# EasyEDA Pro project 电磁杆.eprj

# Schematic Schematic1
Create Date: 2024-03-12; Page Name: P1; Project Name: 电磁杆; Schematic Name: Schematic1; Update Date: 2024-03-24; Company: 嘉立创EDA; Page Size: A4; Version: V1.0
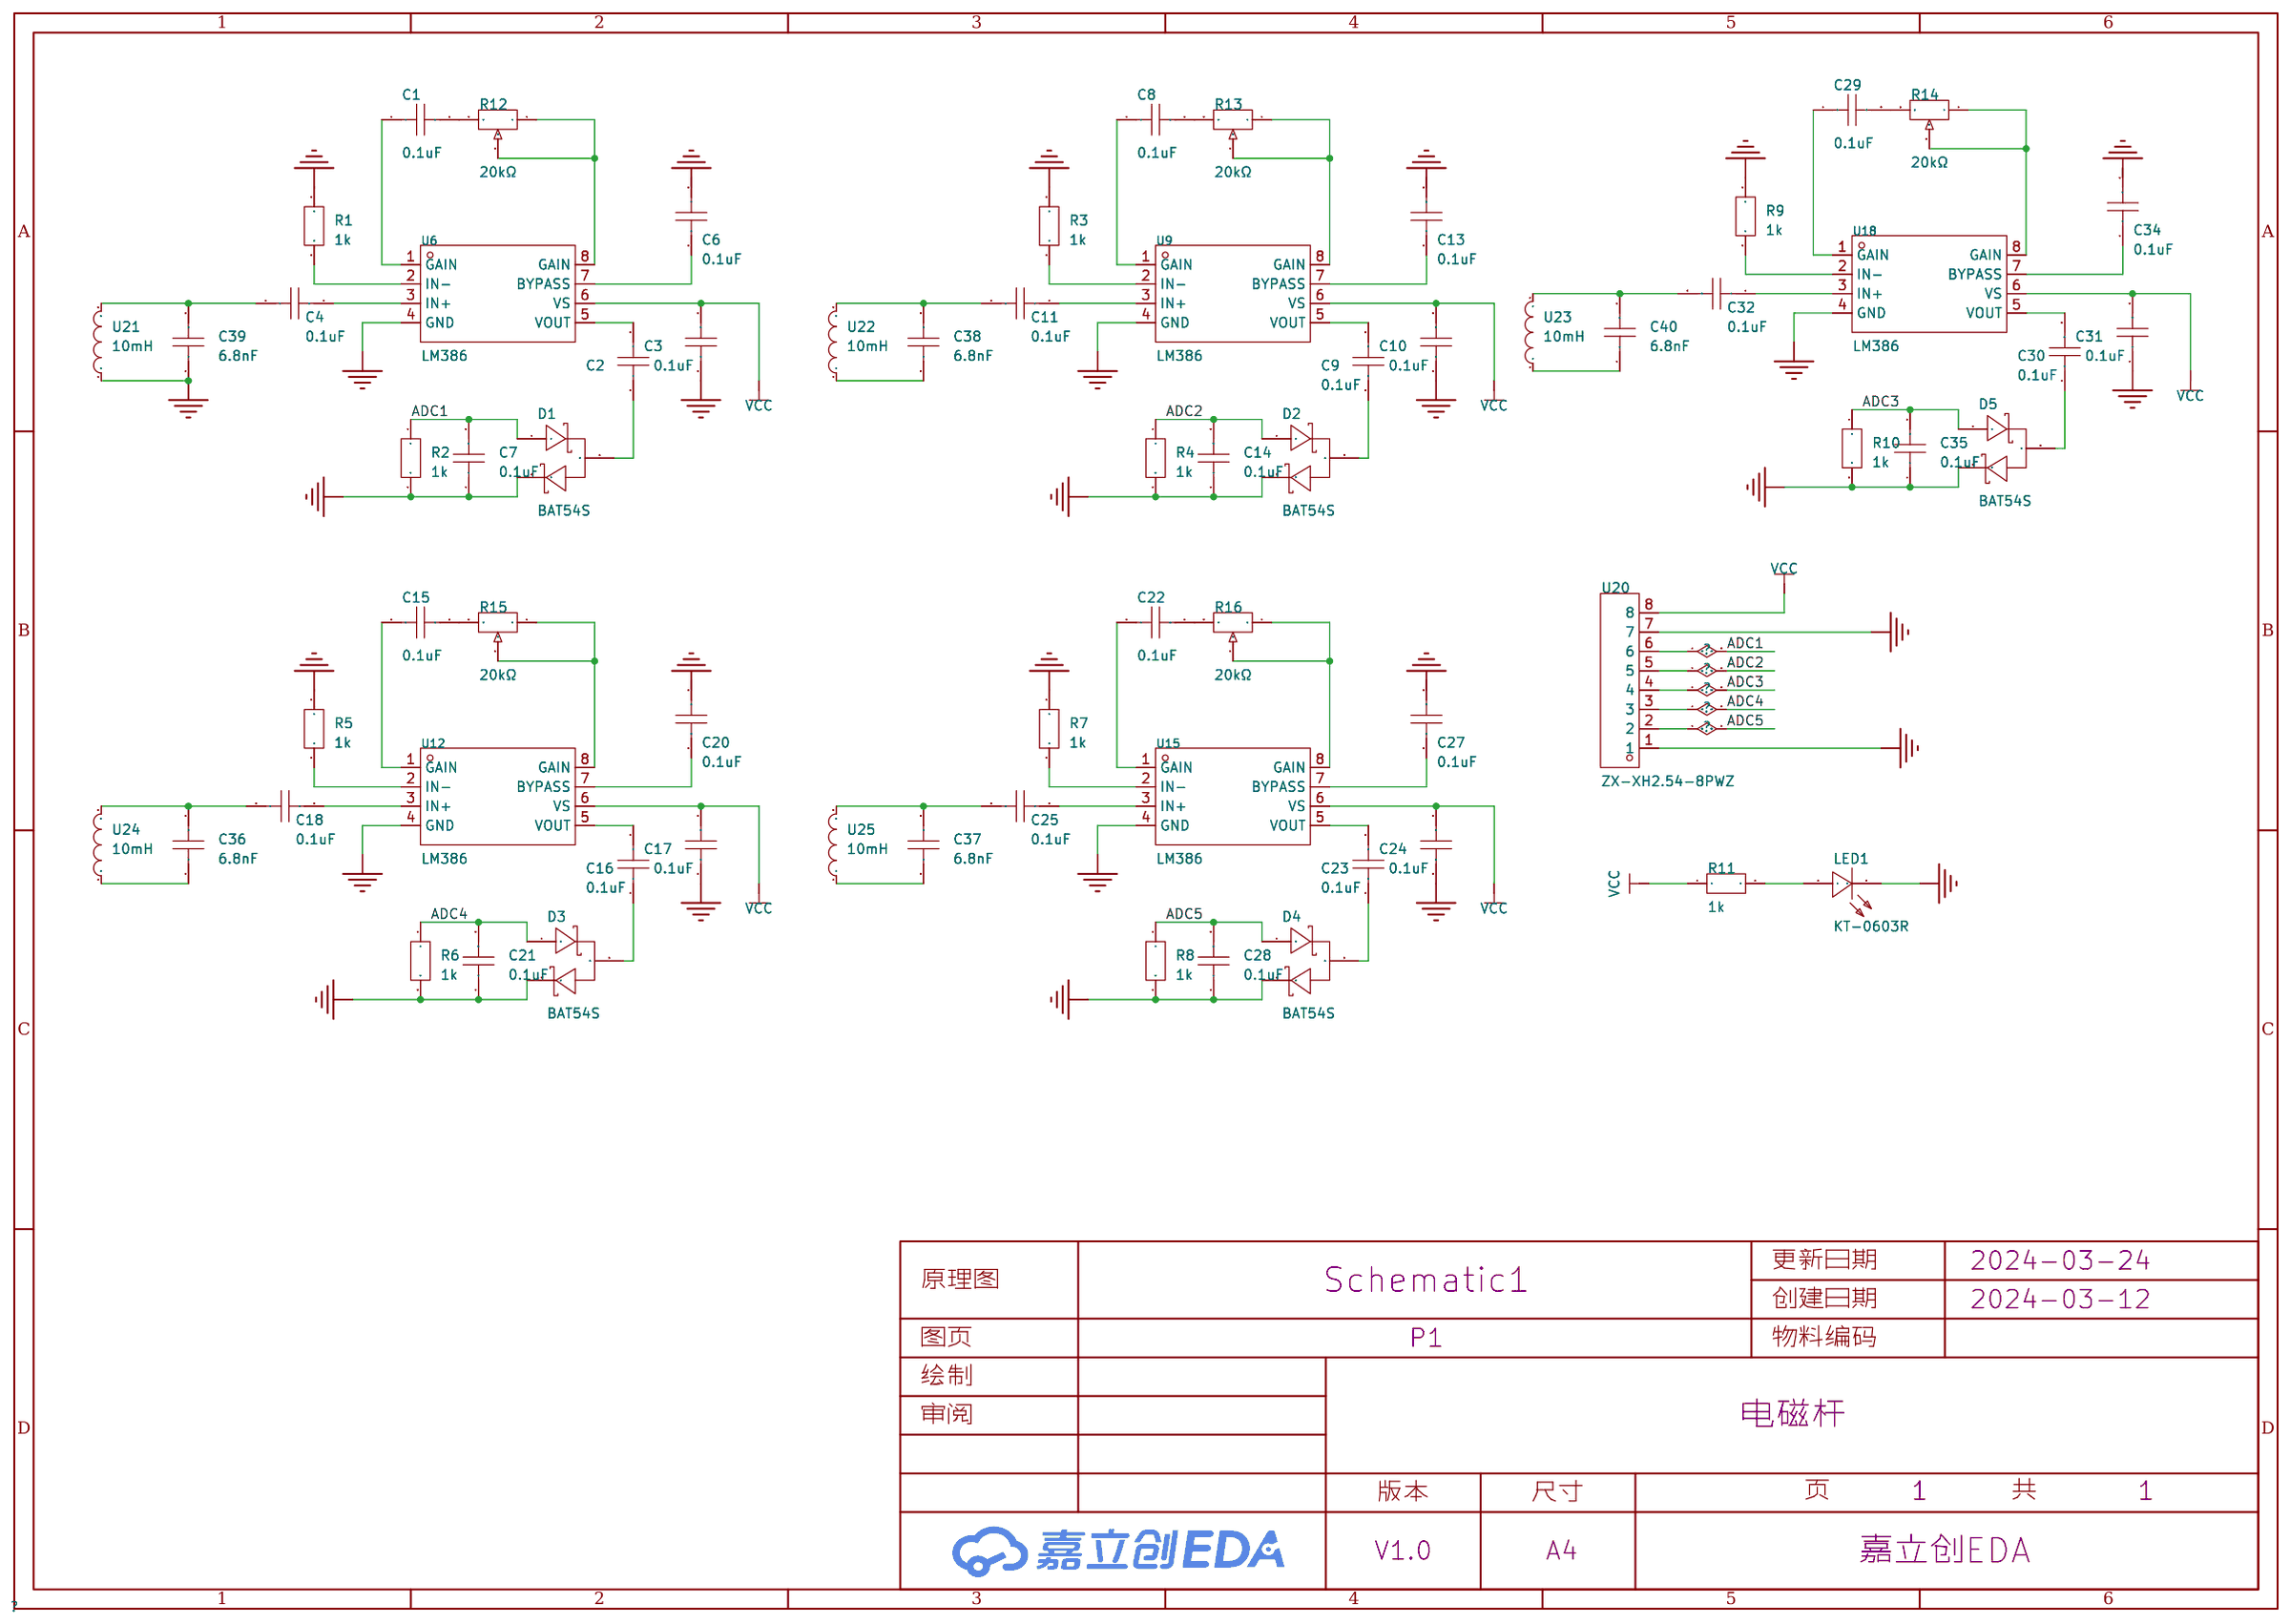
[diagram p0: schematic sheet]

## Parts
C1  0.1uF  [C0805]
C2  104  [C0805]
C3  0.1uF  [C0805]
C4  0.1uF  [C0805]
C6  0.1uF  [C0805]
C7  0.1uF  [C0805]
C8  0.1uF  [C0805]
C9  0.1uF  [C0805]
C10  0.1uF  [C0805]
C11  0.1uF  [C0805]
C13  0.1uF  [C0805]
C14  0.1uF  [C0805]
C15  0.1uF  [C0805]
C16  0.1uF  [C0805]
C17  0.1uF  [C0805]
C18  0.1uF  [C0805]
C20  0.1uF  [C0805]
C21  0.1uF  [C0805]
C22  0.1uF  [C0805]
C23  0.1uF  [C0805]
C24  0.1uF  [C0805]
C25  0.1uF  [C0805]
C27  0.1uF  [C0805]
C28  0.1uF  [C0805]
C29  0.1uF  [C0805]
C30  0.1uF  [C0805]
C31  0.1uF  [C0805]
C32  0.1uF  [C0805]
C34  0.1uF  [C0805]
C35  0.1uF  [C0805]
C36  6.8nF  [CAP-TH_L7.2-W2.5-P5.00-D0.5]
C37  6.8nF  [CAP-TH_L7.2-W2.5-P5.00-D0.5]
C38  6.8nF  [CAP-TH_L7.2-W2.5-P5.00-D0.5]
C39  6.8nF  [CAP-TH_L7.2-W2.5-P5.00-D0.5]
C40  6.8nF  [CAP-TH_L7.2-W2.5-P5.00-D0.5]
D1  BAT54S  [SOT-23-3_L2.9-W1.3-P1.90-LS2.4-BR]
D2  BAT54S  [SOT-23-3_L2.9-W1.3-P1.90-LS2.4-BR]
D3  BAT54S  [SOT-23-3_L2.9-W1.3-P1.90-LS2.4-BR]
D4  BAT54S  [SOT-23-3_L2.9-W1.3-P1.90-LS2.4-BR]
D5  BAT54S  [SOT-23-3_L2.9-W1.3-P1.90-LS2.4-BR]
LED1  KT-0603R  [LED0603-RD]
R1  1k  [R0805]
R2  1k  [R0805]
R3  1k  [R0805]
R4  1k  [R0805]
R5  1k  [R0805]
R6  1k  [R0805]
R7  1k  [R0805]
R8  1k  [R0805]
R9  1k  [R0805]
R10  1k  [R0805]
R11  1k  [R0805]
R12  20kΩ  [RES-ADJ-TH_3P-L7.1-W6.9-P2.50-L_3362P]
R13  20kΩ  [RES-ADJ-TH_3P-L7.1-W6.9-P2.50-L_3362P]
R14  20kΩ  [RES-ADJ-TH_3P-L7.1-W6.9-P2.50-L_3362P]
R15  20kΩ  [RES-ADJ-TH_3P-L7.1-W6.9-P2.50-L_3362P]
R16  20kΩ  [RES-ADJ-TH_3P-L7.1-W6.9-P2.50-L_3362P]
U6  LM386  [SOP-8_L4.9-W3.9-P1.27-LS6.0-BL]
U9  LM386  [SOP-8_L4.9-W3.9-P1.27-LS6.0-BL]
U12  LM386  [SOP-8_L4.9-W3.9-P1.27-LS6.0-BL]
U15  LM386  [SOP-8_L4.9-W3.9-P1.27-LS6.0-BL]
U18  LM386  [SOP-8_L4.9-W3.9-P1.27-LS6.0-BL]
U20  ZX-XH2.54-8PWZ  [CONN-TH_8P-P2.50_ZX-XH2.54-8PWZ]
U21  10mH  [IND-TH_BD10.0-P5.00-D0.6]
U22  10mH  [IND-TH_BD10.0-P5.00-D0.6]
U23  10mH  [IND-TH_BD10.0-P5.00-D0.6]
U24  10mH  [IND-TH_BD10.0-P5.00-D0.6]
U25  10mH  [IND-TH_BD10.0-P5.00-D0.6]

## Library data of the parts
C1-C4 C6-C11 C13-C18 C20-C25 C27-C32 C34 C35 = MSASJ21GBB5476MTNA01: 容值:47uF;精度:±20%;额定电压:6.3V;材质(温度系数):X5R;; LCSC Part Name: 47uF ±20% 6.3V; Supplier Part: C5785393; Manufacturer: TAIYO YUDEN(太诱); Supplier Footprint: 0805; JLCPCB Part Class: 扩展库; Supplier: LCSC; Tolerance: ±20%; Voltage Rated: 6.3V; Temperature Coefficient: X5R
C36-C40 = PE104J2A0501: 容值:100nF;精度:±5%;额定电压:100V;介电材料:金属化聚酯;工作温度:-40℃~+85℃;; LCSC Part Name: 100nF ±5% 100V; Supplier Part: C390170; Manufacturer: KYET(科雅); Supplier Footprint: 插件,P=5mm; JLCPCB Part Class: 扩展库; Datasheet: https://atta.szlcsc.com/upload/public/pdf/source/20190521/C390170_A02C70B339AE0619C0AA1506FED178D7.pdf; Supplier: LCSC; Tolerance: ±5%; Voltage Rated: 100V; Dielectric Material: 金属化聚酯; Operating Temperature: -40℃~+85℃
D1-D5 = BAT54S: 正向压降(Vf):1V@100mA;直流反向耐压(Vr):30V;平均整流电流(Io):200mA;; LCSC Part Name: 电压:30V 电流:200mA; Supplier Part: C266597; Manufacturer: BORN(伯恩半导体); Supplier Footprint: SOT-23; JLCPCB Part Class: 扩展库; Datasheet: https://atta.szlcsc.com/upload/public/pdf/source/20180817/C266598_47D685828EC8A63CBB2EC9BA7E026BE3.pdf; Supplier: LCSC; Forward Voltage (Vf@If): 1V@100mA; Reverse Voltage (Vr): 30V; Average Rectified Current (Io): 200mA
LED1 = KT-0603R: 发光颜色:红色;功率:-;正向电流:-;主波长:-;二极管配置:-;透镜颜色:-;色温:-;发光角度:-;载带方式:-;工作温度:-40℃~+85℃;; LCSC Part Name: 0603 红灯 高亮; Supplier Part: C2286; Manufacturer: KENTO; Supplier Footprint: 0603; JLCPCB Part Class: 基础库; Datasheet: https://atta.szlcsc.com/upload/public/pdf/source/20160616/1466072038404.pdf; Supplier: LCSC; Emitted Color: 红色; Operating Temperature: -40℃~+85℃
R1-R11 = AT0805BRD0720RL: 电阻类型:薄膜电阻;阻值:20Ω;精度:±0.1%;功率:125mW;温度系数:±25ppm/℃;; LCSC Part Name: 薄膜电阻 20Ω ±0.1% 125mW; Supplier Part: C856772; Manufacturer: YAGEO(国巨); Supplier Footprint: 0805; JLCPCB Part Class: 扩展库; Datasheet: https://atta.szlcsc.com/upload/public/pdf/source/20200722/C705050_417A31AEACA91CF136F24197E9C952D0.pdf; Supplier: LCSC; Type: 薄膜电阻; Tolerance: ±0.1%; Power(Watts): 125mW; Temperature Coefficient: ±25ppm/℃; Operating Temperature Range: -55℃~+155℃
R12-R16 = 3362P-1-203: 阻值:20kΩ;精度:±10%;; LCSC Part Name: 20kΩ ±10%; Supplier Part: C118933; Manufacturer: BOCHEN(博晨); Supplier Footprint: 插件; JLCPCB Part Class: 扩展库; Datasheet: https://atta.szlcsc.com/upload/public/pdf/source/20171114/C118933_15106326602881117422.pdf; Supplier: LCSC; Tolerance: ±10%
U6 U9 U12 U15 U18 = LM386: Supplier Part: C5157706; Manufacturer: Gcore(扬州国芯); Supplier Footprint: SOP-8; JLCPCB Part Class: 扩展库; Datasheet: https://atta.szlcsc.com/upload/public/pdf/source/20220906/6E1127E4FF7F93C2DEC6318A108F5403.pdf; Supplier: LCSC
U20 = ZX-XH2.54-8PWZ: 插针结构:1x8P;间距:2.54mm;安装方式:弯插;参考系列:XH;总PIN数:8P;排数:1;每排PIN数:8;行距:-;额定电流:3A;触头材质:黄铜;触头镀层:锡;工作温度范围:-25℃~+85℃;; Supplier Part: C7429647; Manufacturer: Megastar(兆星); Supplier Footprint: 弯插,P=2.54mm; JLCPCB Part Class: 扩展库; Datasheet: https://atta.szlcsc.com/upload/public/pdf/source/20230619/825E28BFFB9F3B9EEDAD896C78D625B2.pdf; Supplier: LCSC; Pins Structure: 1x8P; Pitch: 2.54mm; Mounting Style: 弯插; Reference Series: XH; Number of Pins: 8P; Number of Rows: 1; Number of PINs Per Row: 8; Current Rating (Max): 3A; Contact Material: 黄铜; Contact Plating: 锡; Operating Temperature Range: -25℃~+85℃
U21-U25 = YDPK0810-103K: 电感值:10mH;精度:±10%;饱和电流(Isat):70mA;类型:工字电感;; LCSC Part Name: 10mH ±10% 70mA; Supplier Part: C7541664; Manufacturer: YJYCOIN(益嘉源); Supplier Footprint: 插件,D10xL14mm; JLCPCB Part Class: Extended Part; Datasheet: https://atta.szlcsc.com/upload/public/pdf/source/20230822/1A44854BA5B5AF506579C5E5A848AF4B.pdf; Supplier: LCSC; Tolerance: ±10%; Saturation Current (Isat): 70mA; DC Resistance (DCR): 22Ω; Type: 工字电感

## Nets
GND: C3.1 C6.2 C7.1 C10.1 C13.2 C14.1 C17.1 C20.2 C21.1 C24.1 C27.2 C28.1 C31.1 C34.2 C35.1 C39.1 D1.2 D2.2 D3.2 D4.2 D5.2 LED1.1(K) R1.1 R2.2 R3.1 R4.2 R5.1 R6.2 R7.1 R8.2 R9.1 R10.2 U6.4(GND) U9.4(GND) U12.4(GND) U15.4(GND) U18.4(GND) U20.1 U20.7 U21.1
VCC: C3.2 C10.2 C17.2 C24.2 C31.2 R11.1 U6.6(VS) U9.6(VS) U12.6(VS) U15.6(VS) U18.6(VS) U20.8
ADC1: C7.2 D1.1 R2.1 U20.6
ADC2: C14.2 D2.1 R4.1 U20.5
ADC3: C35.2 D5.1 R10.1 U20.4
ADC4: C21.2 D3.1 R6.1 U20.3
ADC5: C28.2 D4.1 R8.1 U20.2
$1N952: C4.1 U6.3(IN+)
$1N959: C4.2 C39.2 U21.2
$1N966: R1.2 U6.2(IN-)
$1N1099: C1.1 U6.1(GAIN)
$1N1107: R12.1 R12.2 U6.8(GAIN)
$1N1252: C6.1 U6.7(BYPASS)
$1N1341: C2.2 U6.5(VOUT)
$1N2001: C2.1 D1.3
$1N2538: C11.1 U9.3(IN+)
$1N2540: C11.2 C38.2 U22.2
$1N2543: C38.1 U22.1
$1N2549: C8.1 U9.1(GAIN)
$1N2552: R13.1 R13.2 U9.8(GAIN)
$1N2568: C9.2 U9.5(VOUT)
$1N2570: C13.1 U9.7(BYPASS)
$1N2573: R3.2 U9.2(IN-)
$1N2585: C9.1 D2.3
$1N3129: C18.1 U12.3(IN+)
$1N3131: C18.2 C36.2 U24.2
$1N3134: C36.1 U24.1
$1N3140: C15.1 U12.1(GAIN)
$1N3143: R15.1 R15.2 U12.8(GAIN)
$1N3159: C16.2 U12.5(VOUT)
$1N3161: C20.1 U12.7(BYPASS)
$1N3164: R5.2 U12.2(IN-)
$1N3176: C16.1 D3.3
$1N3720: C25.1 U15.3(IN+)
$1N3722: C25.2 C37.2 U25.2
$1N3725: C37.1 U25.1
$1N3731: C22.1 U15.1(GAIN)
$1N3734: R16.1 R16.2 U15.8(GAIN)
$1N3750: C23.2 U15.5(VOUT)
$1N3752: C27.1 U15.7(BYPASS)
$1N3755: R7.2 U15.2(IN-)
$1N3767: C23.1 D4.3
$1N4311: C32.1 U18.3(IN+)
$1N4313: C32.2 C40.2 U23.2
$1N4316: C40.1 U23.1
$1N4322: C29.1 U18.1(GAIN)
$1N4325: R14.1 R14.2 U18.8(GAIN)
$1N4341: C30.2 U18.5(VOUT)
$1N4343: C34.1 U18.7(BYPASS)
$1N4346: R9.2 U18.2(IN-)
$1N4358: C30.1 D5.3
$1N11906: C1.2 R12.3
$1N11943: C8.2 R13.3
$1N11980: C29.2 R14.3
$1N12017: C15.2 R15.3
$1N12060: C22.2 R16.3
Net-(LED1-2): LED1.2(A) R11.2

# Board PCB1
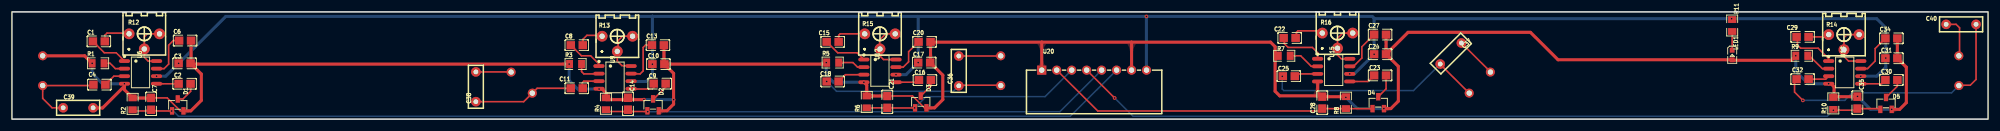
[diagram p1: board, top side]
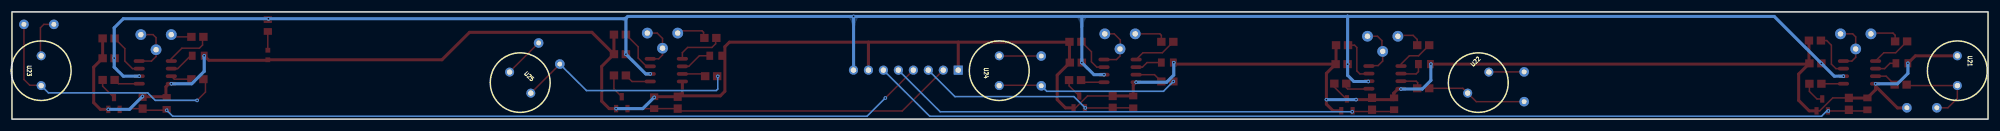
[diagram p2: board, bottom side, seen from below]

Outline 330 x 18 mm; copper layers: Top Layer, Bottom Layer. Coordinates in mm from the lower left corner of the outline.
Outline path: rectangle 0,18 330,0
Stack: Top Layer 0.035mm / Dielectric1 1.51mm FR4 er 4.5 / Bottom Layer 0.035mm

## Design rules (mm)
template: JLCPCB Capability(Two Layers Board)
spacing copperThickness1oz (default): track to track 0.102, other pairs 0.152 to 0.3
spacing copperThickness2oz: track to track 0.203, other pairs 0.152 to 0.3
track width copperThickness1oz (default): min 0.127, default 0.254, max 2.54
track width copperThickness2oz: min 0.203, default 0.254, max 2.54
differential pair differentialPair (default): width min 0.127, default 0.254, max 2.54; gap min 0.152, default 0.152
via viaSize (default): diameter min 0.5, default 0.61, max 10; hole min 0.3, default 0.305, max 6.3

## Placement (name value [footprint] x y rotation side)
C1  0.1uF  [C0805]  14.51 13.05 0 top
C2  104  [C0805]  28.83 5.94 180 top
C3  0.1uF  [C0805]  28.83 9.36 180 top
C4  0.1uF  [C0805]  14.59 5.79 180 top
C6  0.1uF  [C0805]  28.91 13.19 0 top
C7  0.1uF  [C0805]  23.24 2.56 270 top
C8  0.1uF  [C0805]  94.32 12.41 0 top
C9  0.1uF  [C0805]  108.17 5.96 180 top
C10  0.1uF  [C0805]  107.95 9.22 180 top
C11  0.1uF  [C0805]  94.32 5.17 180 top
C13  0.1uF  [C0805]  107.88 12.41 0 top
C14  0.1uF  [C0805]  102.87 2.57 270 top
C15  0.1uF  [C0805]  137.06 12.98 0 top
C16  0.1uF  [C0805]  152.46 6.55 180 top
C17  0.1uF  [C0805]  152.34 9.49 180 top
C18  0.1uF  [C0805]  137.06 6.32 180 top
C20  0.1uF  [C0805]  152.4 12.98 0 top
C21  0.1uF  [C0805]  146.18 2.89 270 top
C22  0.1uF  [C0805]  213.37 13.63 0 top
C23  0.1uF  [C0805]  228.47 7.33 180 top
C24  0.1uF  [C0805]  228.47 10.9 180 top
C25  0.1uF  [C0805]  213.23 7.2 180 top
C27  0.1uF  [C0805]  228.47 14.19 0 top
C28  0.1uF  [C0805]  218.82 2.76 270 top
C29  0.1uF  [C0805]  299.04 13.81 0 top
C30  0.1uF  [C0805]  313.86 6.57 180 top
C31  0.1uF  [C0805]  313.86 10.22 180 top
C32  0.1uF  [C0805]  299.04 6.7 180 top
C34  0.1uF  [C0805]  313.86 13.55 0 top
C35  0.1uF  [C0805]  308.18 2.76 270 top
C36  6.8nF  [CAP-TH_L7.2-W2.5-P5.00-D0.5]  158.12 8.09 270 top
C37  6.8nF  [CAP-TH_L7.2-W2.5-P5.00-D0.5]  240.28 11.02 225 top
C38  6.8nF  [CAP-TH_L7.2-W2.5-P5.00-D0.5]  77.47 5.43 270 top
C39  6.8nF  [CAP-TH_L7.2-W2.5-P5.00-D0.5]  11.05 1.9 180 top
C40  6.8nF  [CAP-TH_L7.2-W2.5-P5.00-D0.5]  325.5 15.91 0 top
D1  BAT54S  [SOT-23-3_L2.9-W1.3-P1.90-LS2.4-BR]  27.69 2.38 270 top
D2  BAT54S  [SOT-23-3_L2.9-W1.3-P1.90-LS2.4-BR]  107.06 2.4 270 top
D3  BAT54S  [SOT-23-3_L2.9-W1.3-P1.90-LS2.4-BR]  151.77 2.89 270 top
D4  BAT54S  [SOT-23-3_L2.9-W1.3-P1.90-LS2.4-BR]  228.16 2.76 270 top
D5  BAT54S  [SOT-23-3_L2.9-W1.3-P1.90-LS2.4-BR]  312.97 2.63 270 top
LED1  KT-0603R  [LED0603-RD]  287.27 10.76 270 top
R1  1k  [R0805]  14.38 9.37 0 top
R2  1k  [R0805]  20.15 2.56 90 top
R3  1k  [R0805]  94.12 9.24 0 top
R4  1k  [R0805]  99.19 2.57 90 top
R5  1k  [R0805]  137.06 9.49 0 top
R6  1k  [R0805]  142.75 2.89 90 top
R7  1k  [R0805]  212.47 10.63 0 top
R8  1k  [R0805]  222.76 2.76 90 top
R9  1k  [R0805]  298.9 10.63 0 top
R10  1k  [R0805]  304.17 2.63 90 top
R11  1k  [R0805]  287.27 15.71 270 top
R12  20kΩ  [RES-ADJ-TH_3P-L7.1-W6.9-P2.50-L_3362P]  22.1 13.05 180 top
R13  20kΩ  [RES-ADJ-TH_3P-L7.1-W6.9-P2.50-L_3362P]  101.09 12.64 180 top
R14  20kΩ  [RES-ADJ-TH_3P-L7.1-W6.9-P2.50-L_3362P]  305.94 12.92 180 top
R15  20kΩ  [RES-ADJ-TH_3P-L7.1-W6.9-P2.50-L_3362P]  144.96 13.05 180 top
R16  20kΩ  [RES-ADJ-TH_3P-L7.1-W6.9-P2.50-L_3362P]  221.36 13.17 180 top
U6  LM386  [SOP-8_L4.9-W3.9-P1.27-LS6.0-BL]  21.46 7.84 270 top
U9  LM386  [SOP-8_L4.9-W3.9-P1.27-LS6.0-BL]  100.71 7 270 top
U12  LM386  [SOP-8_L4.9-W3.9-P1.27-LS6.0-BL]  144.95 8.09 270 top
U15  LM386  [SOP-8_L4.9-W3.9-P1.27-LS6.0-BL]  220.73 8.22 270 top
U18  LM386  [SOP-8_L4.9-W3.9-P1.27-LS6.0-BL]  306.07 7.84 270 top
U20  ZX-XH2.54-8PWZ  [CONN-TH_8P-P2.50_ZX-XH2.54-8PWZ]  180.72 8.22 0 top
U21  10mH  [IND-TH_BD10.0-P5.00-D0.6]  5.13 8.13 270 bottom
U22  10mH  [IND-TH_BD10.0-P5.00-D0.6]  85.13 6.13 315 bottom
U23  10mH  [IND-TH_BD10.0-P5.00-D0.6]  325.13 8.13 270 bottom
U24  10mH  [IND-TH_BD10.0-P5.00-D0.6]  165.13 8.13 270 bottom
U25  10mH  [IND-TH_BD10.0-P5.00-D0.6]  245.13 6.13 225 bottom

## Footprints (pads in the part's own frame, mm; a bottom-side part is the same pattern mirrored in y, then rotated)
C0805
  rect 1.41x1.35 smd: 1(-1,0) 2(1,0)
CAP-TH_L7.2-W2.5-P5.00-D0.5
  round 1.6 hole 0.8: 1(-2.5,0) 2(2.5,0)
CONN-TH_8P-P2.50_ZX-XH2.54-8PWZ
  rect 1.524x1.524 hole 0.914: 1(-8.75,0)
  round 1.524 hole 0.914: 2(-6.25,0) 3(-3.75,0) 4(-1.25,0) 5(1.25,0) 6(3.75,0) 7(6.25,0) 8(8.75,0)
IND-TH_BD10.0-P5.00-D0.6
  round 1.5 hole 0.9: 1(-2.5,0) 2(2.5,0)
LED0603-RD
  rect 0.8x0.8 smd: 1(-0.799,-0.004) 2(0.799,0.004)
R0805
  rect 1.133x1.377 smd: 1(-1,0) 2(1,0)
RES-ADJ-TH_3P-L7.1-W6.9-P2.50-L_3362P
  round 1.8 hole 0.9: 1(-2.54,-1.27) 2(0,1.27) 3(2.54,-1.27)
SOP-8_L4.9-W3.9-P1.27-LS6.0-BL
  oval 0.63x1.865 smd: 1(-1.905,-2.683) 2(-0.635,-2.683) 3(0.635,-2.683) 4(1.905,-2.683) 5(1.905,2.683) 6(0.635,2.683) 7(-0.635,2.683) 8(-1.905,2.683)
SOT-23-3_L2.9-W1.3-P1.90-LS2.4-BR
  rect 1.25x0.7 smd: 1(1,-0.95) 2(1,0.95) 3(-1,0)

## Nets
As in the schematic, except:
GND: C3.1 C6.2 C7.1 C10.1 C13.2 C14.1 C17.1 C20.2 C21.1 C24.1 C27.2 C28.1 C31.1 C34.2 C35.1 C39.1 D1.2 D2.2 D3.2 D4.2 D5.2 LED1.2 R1.1 R2.2 R3.1 R4.2 R5.1 R6.2 R7.1 R8.2 R9.1 R10.2 U6.4 U9.4 U12.4 U15.4 U18.4 U20.1 U20.7 U21.1
$1N4988: LED1.1 R11.2

## Via types
v1: diameter 0.61, hole 0.305, Top Layer to Bottom Layer, 42 vias

## Routing (per net, layer and track width the routed paths; a pad name or vN(x,y) marks a point on that pad's centre or on a via; arc(x,y) is an arc through that point)
GND: length 433.8
  Top Layer w0.254: D3.2 152.38,1.89 150.38,3.89 C21.1 ; D1.2 28.11,1.38 25.93,3.56 C7.1 ; 20.02,3.44 R2.2
  Top Layer w0.508: 304.29,3.76 R10.2 ; 304.29,3.76 304.29,5.43 303.78,5.94 v1(303.39,5.94) ; 304.29,3.76 C35.1 ; U15.4 218.04,4.16 218.42,4.16 ; v1(18.78,5.94) 18.78,5.53 ; 18.78,5.53 18.81,5.55 ; 18.78,5.53 18.78,4.93 R2.2 ; 18.78,5.53 15.13,1.87 14.21,1.87 14.18,1.9 ; D1.2 29.86,1.38 31.62,3.14 31.62,7.56 C3.1 29.91,9.44 ; C24.1 231.52,8.85 231.52,3.01 230.27,1.76 v1(229.11,1.76) ; C24.1 C27.2 ; C24.1 233.15,14.57 253.59,14.57 258.19,9.96 LED1.2 ; U20.7 186.97,12.92 ; 186.97,12.92 171.97,12.92 ; 186.97,12.92 210.19,12.92 210.95,12.16 210.95,4.66 211.71,3.9 218.42,3.9 218.42,4.16 ; v1(297.9,10.63) 297.13,9.87 287.15,9.87 ; U21.1 12.13,10.63 v1(13.38,9.37) ; C13.2 108.88,9.29 108.94,9.24 ; 20.02,3.44 20.2,3.53 22.94,3.53 23.08,3.39 ; 29.91,9.44 30.1,9.24 R3.1 ; 29.91,9.44 C6.2 ; 135.75,9.8 R5.1 135.8,9.24 108.96,9.24 ; v1(98.04,5.05) 98.55,5.05 99.25,4.35 99.23,4.33 99.23,3.27 ; 99.23,3.27 102.64,3.27 ; 171.97,12.92 153.46,12.92 C20.2 153.4,9.55 C17.1 155.45,7.38 155.45,3.27 154.07,1.89 D3.2 ; 171.97,12.92 U20.1 ; C21.1 R6.2 142.75,5.71 v1(142.27,6.19) ; 108.94,9.24 C10.1 110.49,7.68 v1(110.49,3.27) 110.49,2.51 109.38,1.4 D2.2 ; 108.94,9.24 108.96,9.24 ; 218.82,3.65 C28.1 ; C28.1 R8.2 ; C28.1 218.42,4.16 ; 108.96,9.24 109.09,9.36 ; v1(313.92,1.63) 315.23,1.63 316.36,2.76 316.36,8.72 C31.1 C34.2 ; 102.77,3.27 v1(105.54,3.27)
  Bottom Layer w0.508: v1(18.78,5.94) 15.11,5.94 13.38,7.66 v1(13.38,9.37) ; v1(229.11,1.76) 224.65,1.76 v1(222.76,3.65) ; v1(142.27,6.19) 137.19,6.19 135.98,7.39 v1(135.98,9.49) ; v1(313.92,1.63) 310.37,1.63 v1(308.2,3.81) ; v1(303.39,5.94) 299.97,5.94 297.9,8.01 v1(297.9,10.63) ; v1(98.04,5.05) 94.49,5.05 93.05,6.49 v1(93.05,9.24) ; 110.49,3.27 v1(105.54,3.27)
VCC: length 351.8
  Bottom Layer w0.508: 151.26,17.24 151.34,17.16 v1(151.34,9.49) 149.31,7.46 v1(147.63,7.46) ; 151.26,17.24 v1(189.45,17.24) ; 151.26,17.24 106.95,17.24 ; 227.47,16.93 v1(227.47,10.9) 224.16,7.59 v1(223.41,7.59) ; 227.47,16.93 227.17,17.24 v1(189.45,17.24) ; 227.47,16.93 227.65,16.86 v1(287.18,16.86) 311.4,16.86 312.93,15.33 v1(312.93,10.25) 312.93,8.73 311.4,7.2 v1(308.75,7.2) ; v1(189.45,17.24) 189.45,8.24 v1(189.47,8.22) ; 106.95,17.24 v1(106.95,9.22) 106.95,7.35 105.92,6.32 v1(103.5,6.32) ; 106.95,17.24 106.95,17.29 106.9,17.24 ; 106.95,17.24 106.9,17.24 ; 106.9,17.24 35.71,17.24 v1(27.83,9.36) 25.68,7.2 v1(24.15,7.2)
ADC1: length 168.1
  Top Layer w0.254: R2.1 20.34,1.36 v1(26.67,1.36) 26.72,1.36 D1.1
  Bottom Layer w0.254: U20.6 176.72,0.47 27.81,0.47 26.92,1.36 v1(26.67,1.36)
ADC2: length 85.6
  Top Layer w0.254: 106.11,1.27 99.18,1.27
  Bottom Layer w0.254: v1(106.17,1.24) 174.99,1.24 v1(181.97,8.22)
ADC3: length 136.5
  Top Layer w0.254: v1(179.47,8.22) v1(184.15,3.54) 184.15,3.52 ; 304.2,1.9 304.61,1.49 307.91,1.49 C35.2 311.89,1.76 D5.1
  Bottom Layer w0.254: v1(184.15,3.54) 187.22,0.47 303.15,0.47 v1(304.17,1.49)
ADC4: length 36.9
  Top Layer w0.254: R6.1 C21.2 146.19,1.87 v1(150.75,1.87)
  Bottom Layer w0.254: v1(176.97,8.22) 172.53,3.78 152.65,3.78 v1(150.75,1.87)
ADC5: length 55.7
  Top Layer w0.254: D4.1 R8.1 C28.2 218.42,1.36 181.33,1.36 v1(174.47,8.22)
$1N952: length 3.8
  Top Layer w0.254: U6.3 17.01,7.2 C4.1
$1N959: length 15.7
  Top Layer w0.254: 9.18,1.9 6.71,1.9 5.13,3.47 U21.2 13.43,5.63 C4.2
  Bottom Layer w0.254: 8.86,1.9 9.18,1.9
$1N966: length 3.8
  Top Layer w0.254: R1.2 16.38,9.37 17.27,8.47 U6.2
$1N1099: length 6.6
  Top Layer w0.254: U6.1 18.78,9.76 17.4,11.14 15.42,11.14 C1.1
$1N1107: length 8.5
  Top Layer w0.254: U6.8 22.73,9.74 22.1,10.38 22.1,13.81 22.61,14.32 R12.1
$1N1252: length 7.6
  Top Layer w0.254: C6.1 26.94,13.19 26.16,12.41 26.16,9.24 25.4,8.47 U6.7
$1N1341: length 3.7
  Top Layer w0.254: U6.5 C2.2
$1N2001: length 4
  Top Layer w0.254: D1.3 28.56,3.38 29.83,4.65 C2.1
$1N2538: length 3.6
  Top Layer w0.254: U9.3 95.5,6.37 95.25,6.11 95.25,5.56 95.12,5.43
$1N2540: length 16.8
  Top Layer w0.254: C11.2 87.71,5.17 U22.2 85.46,2.93 C38.2
$1N2543: length 5.9
  Top Layer w0.254: U22.1 83.33,7.93 C38.1
$1N2549: length 6
  Top Layer w0.254: 98.03,9.24 96.63,10.63 95.1,10.63 C8.1
$1N2552: length 8.8
  Top Layer w0.254: 103.63,13.91 101.96,13.91 101.22,13.17 101.22,11.5 R13.2 101.09,9.74 101.85,8.98 103.32,8.98 U9.8
$1N2568: length 5.1
  Top Layer w0.254: C9.2 107.17,5.28 106.93,5.05 103.01,5.05 102.89,4.92
$1N2570: length 8.2
  Top Layer w0.254: C13.1 105.79,12.41 105.41,12.03 105.41,8.09 104.9,7.59 103.01,7.59
$1N2573: length 4.4
  Top Layer w0.254: U9.2 97.98,7.59 95.5,7.59 95.12,7.97 R3.2
$1N2585: length 3.6
  Top Layer w0.254: C9.1 109.17,5.37 107.06,3.27
$1N3129: length 4.7
  Top Layer w0.254: U12.3 139.2,7.46 C18.1
$1N3131: length 30.1
  Top Layer w0.254: C36.2 158.2,5.68 v1(165.1,5.68)
  Bottom Layer w0.254: v1(136.06,6.32) 137.71,4.66 157.19,4.66 C36.2
$1N3134: length 7
  Top Layer w0.254: U24.1 165.09,10.59 C36.1
  vias: v1(165.1,10.63)
$1N3140: length 7.4
  Top Layer w0.254: U12.1 141.12,11.14 137.89,11.14 C15.1
$1N3143: length 8.7
  Top Layer w0.254: R15.1 145.92,14.32 144.91,13.3 144.91,11.83 R15.2 144.96,10.58 145.54,10 147.63,10
$1N3159: length 4
  Top Layer w0.254: C16.2 151.1,6.19 147.63,6.19
$1N3161: length 6.5
  Top Layer w0.254: 147.63,8.73 148.84,8.73 149.73,9.62 149.73,11.31 C20.1
$1N3164: length 4.5
  Top Layer w0.254: U12.2 141.21,8.73 140.45,9.49 R5.2
$1N3176: length 3.4
  Top Layer w0.254: D3.3 153.46,5.59 C16.1
$1N3720: length 4
  Top Layer w0.254: C25.1 214.61,7.59 218.04,7.59
$1N3722: length 37.4
  Top Layer w0.254: U25.2 238.52,9.2 238.52,9.25
  Bottom Layer w0.254: v1(212.13,7.19) 212.13,5.05 212.39,4.79 234.06,4.79 238.52,9.25
$1N3725: length 6.9
  Top Layer w0.254: C37.1 246.9,7.94 U25.1
$1N3731: length 7.8
  Top Layer w0.254: U15.1 218.04,11.16 217.17,12.03 213.11,12.03 212.49,12.65 212.49,13.28
$1N3734: length 7.5
  Top Layer w0.254: 223.39,14.44 222.25,14.44 221.36,13.55 R16.2 221.36,10.76 222,10.13 U15.8
$1N3750: length 4.5
  Top Layer w0.254: U15.5 226.46,6.32 C23.2
$1N3752: length 7.4
  Top Layer w0.254: U15.7 224.03,8.86 225.43,10.25 225.43,12.14 C27.1
$1N3755: length 5.4
  Top Layer w0.254: 213.34,10.63 215.21,10.63 216.98,8.86 U15.2
$1N3767: length 4.1
  Top Layer w0.254: C23.1 229.47,5.07 D4.3
$1N4311: length 3.6
  Top Layer w0.254: U18.3 302.88,6.7 C32.1
$1N4313: length 43.9
  Top Layer w0.254: v1(299.09,3.14) 297.69,4.54 297.69,6.35 C32.2 ; C40.2 328,6.66 327.03,5.68 325.18,5.68 U23.2
  Bottom Layer w0.254: U23.2 323.91,4.41 307.34,4.41 306.07,3.14 v1(299.09,3.14)
$1N4316: length 7.2
  Top Layer w0.254: C40.1 324.67,15.91 325.25,15.33 325.25,10.75 U23.1
$1N4322: length 8.2
  Top Layer w0.254: 298.17,14.06 298.17,12.43 298.7,11.9 301.62,11.9 303.39,10.14 U18.1
$1N4325: length 9
  Top Layer w0.254: R14.1 306.45,14.19 305.94,13.68 305.94,11.65 R14.2 305.94,10.51 306.7,9.74 U18.8
$1N4341: length 4.4
  Top Layer w0.254: U18.5 312.22,5.94 C30.2
$1N4343: length 7.4
  Top Layer w0.254: C34.1 311.15,11.84 311.15,9.74 309.88,8.47 U18.7
$1N4346: length 4.4
  Top Layer w0.254: R9.2 300.17,10.63 302.33,8.47 U18.2
$1N4358: length 3.7
  Top Layer w0.254: D5.3 314.86,5.53 C30.1
$1N4988: length 2.9
  Top Layer w0.254: R11.2 287.27,11.82 287.27,11.81
$1N11906: length 5.3
  Top Layer w0.254: C1.2 15.51,14.08 15.88,14.44 19.43,14.44 R12.3
$1N11943: length 4.5
  Top Layer w0.254: R13.3 98.4,14.06 96.01,14.06 95.32,13.37 C8.2
$1N11980: length 3.5
  Top Layer w0.254: R14.3 303.02,13.81 C29.2
$1N12017: length 5.6
  Top Layer w0.254: C15.2 138.06,14.07 138.3,14.32 R15.3
$1N12060: length 5.2
  Top Layer w0.254: 214.37,13.25 214.5,13.38 214.5,14.57 214.76,14.82 218.19,14.82

Small or netless copper shapes (teardrops, artwork), in the pictures only: 212 on Top Layer, 23 on Bottom Layer
